# Altium schematic sheet Controller_Section.SchDoc
size A4; SheetNumber: 3; SheetTotal: 3
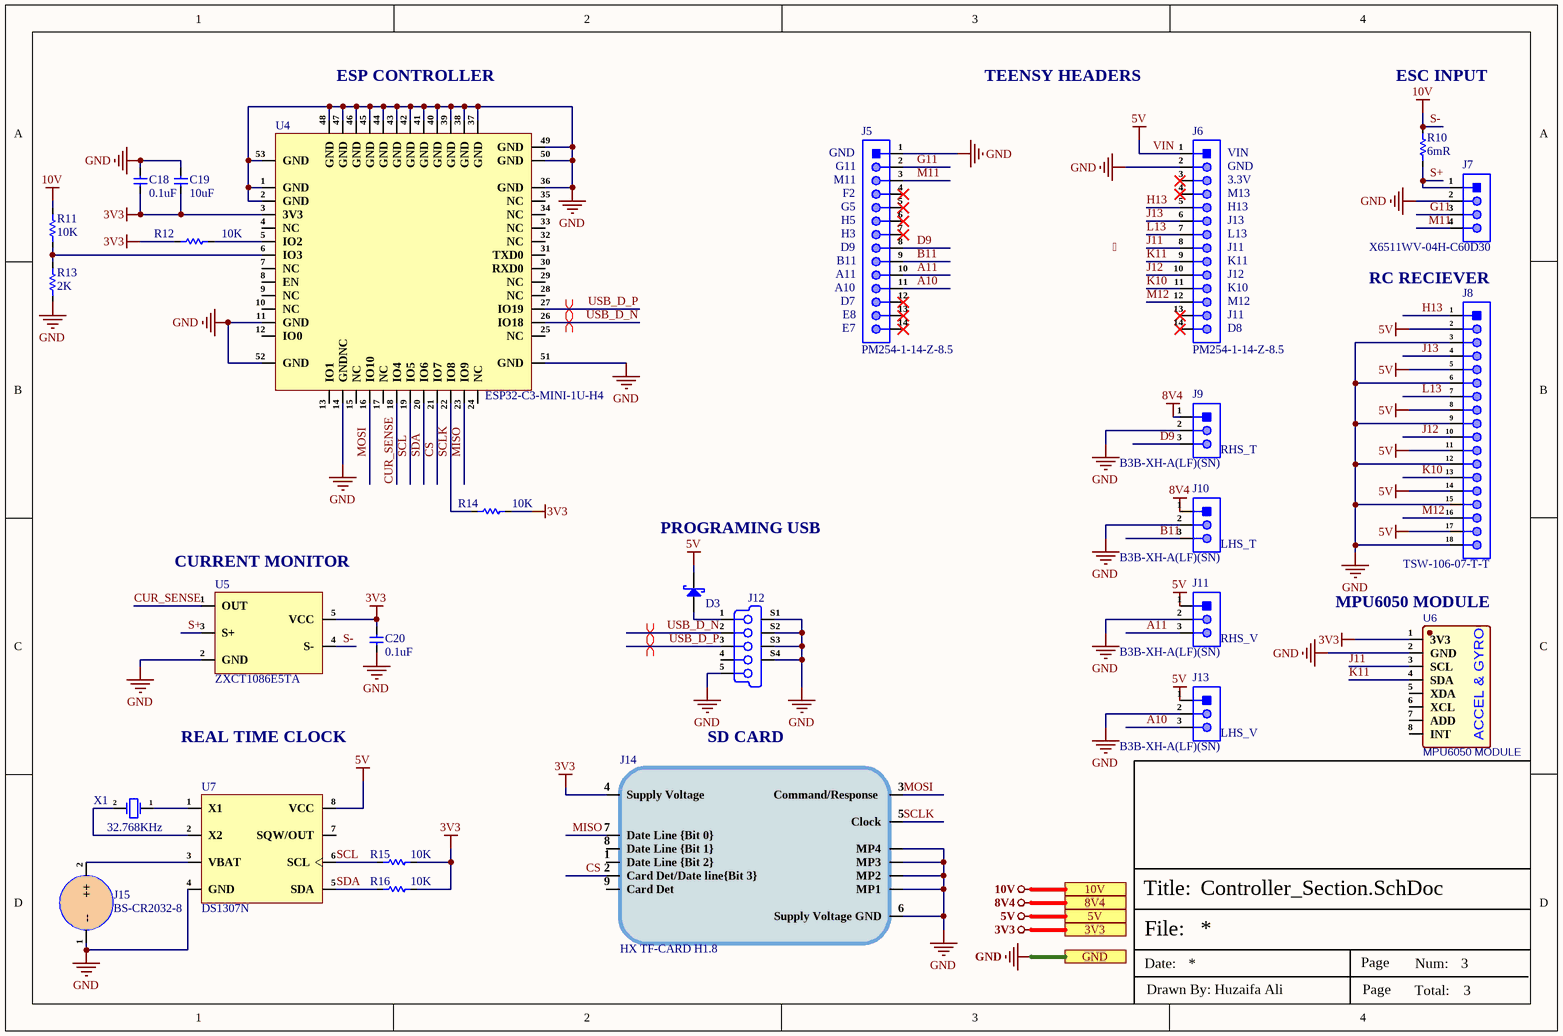
[diagram p0: Controller_Section.SchDoc]

## Parts
C18  0.1uF  [Cap-0402]
C19  10uF  [Cap-0402]
C20  0.1uF  [Cap-0402]
D3  SS34-MS  [SMA(DO-214AC)]  (value not drawn)
J5  PM254-1-14-Z-8.5  [HDR 1x14 TH (Female)]
J6  PM254-1-14-Z-8.5  [HDR 1x14 TH (Female)]
J7  X6511WV-04H-C60D30  [HDR1X4_]
J8  TSW-106-07-T-T  [TSW-106-07-T-T]
J9  B3B-XH-A(LF)(SN)  [B3B-XH-A(LF)(SN)_]
J10  B3B-XH-A(LF)(SN)  [B3B-XH-A(LF)(SN)_]
J11  B3B-XH-A(LF)(SN)  [B3B-XH-A(LF)(SN)_]
J12  HX MICRO XNJ JB  [HX MICRO XNJ JB]  (value not drawn)
J13  B3B-XH-A(LF)(SN)  [B3B-XH-A(LF)(SN)_]
J14  HX TF-CARD H1.8  [HX TF-CARD H1.8]
J15  BS-CR2032-8  [BS-CR2032-8]
R10  6mR  [RES-0805]
R11  10K  [Res-0402]
R12  10K  [Res-0402]
R13  2K  [Res-0402]
R14  10K  [Res-0402]
R15  10K  [Res-0402]
R16  10K  [Res-0402]
U4  ESP32-C3-MINI-1U-H4  [ESP32-C3-MINI-1U-H4.]
U5  ZXCT1086E5TA  [SOT-23-5]
U6  MPU6050 MODULE  [MPU6050_]
U7  DS1307N  [8-PDIP]
X1  32.768KHz  [DT-26]

## Ports
3V3 (see Power_Section[1D]), 5V (see Power_Section[1D]), 8V4 (see Power_Section[1D]), 10V (see Power_Section[1D]), GND (see Power_Section[1D])

## Nets
3V3: C18.1 C19.1 C20.2 J14.4(Supply_Voltage) R12.1 R14.2 R15.2 R16.2 U4.3(3V3) U5.5(VCC) U6.1(3V3) ; port 3V3
8V4: J9.1 J10.1 ; port 8V4
GND: C18.2 C19.2 C20.1 J5.1 J6.2 J7.2 J8.3 J8.6 J8.9 J8.12 J8.15 J8.18 J9.2 J10.2 J11.2 J12.5(GND) J12.S1(Shield) J12.S2(Shield) J12.S3(Shield) J12.S4(Shield) J13.2 J14.6(Supply_Voltage_GND) J14.MP1 J14.MP2 J14.MP3 J14.MP4 J15.1(--) R13.1 U4.1(GND) U4.2(GND) U4.11(GND) U4.14(GNDNC) U4.36(GND) U4.37(GND) U4.38(GND) U4.39(GND) U4.40(GND) U4.41(GND) U4.42(GND) U4.43(GND) U4.44(GND) U4.45(GND) U4.46(GND) U4.47(GND) U4.48(GND) U4.49(GND) U4.50(GND) U4.51(GND) U4.52(GND) U4.53(GND) U5.2(GND) U6.2(GND) U7.4(GND) ; port GND
S-: R10.1 R11.1 U5.4(S-) ; port 10V  [also labelled 10V]
VIN: D3.1(K) J6.1 J8.2 J8.5 J8.8 J8.11 J8.14 J8.17 J11.1 J13.1 U7.8(VCC) ; port 5V  [also labelled 5V]
A10: J5.11 J13.3
A11: J5.10 J11.3
B11: J5.9 J10.3
CS: J14.2(Card_Det/Date_line{Bit_3}) U4.21(IO7)
CUR_SENSE: U4.18(IO4) U5.1(OUT)
D9: J5.8 J9.3
G11: J5.2 J7.3
H13: J6.5 J8.1
J11: J6.8 U6.3(SCL)
J12: J6.10 J8.10
J13: J6.6 J8.4
K10: J6.11 J8.13
K11: J6.9 U6.4(SDA)
L13: J6.7 J8.7
M11: J5.3 J7.4
M12: J6.12 J8.16
MISO: J14.7(Date_Line_{Bit_0}) U4.23(IO9)
MOSI: J14.3(Command/Response) U4.16(IO10)
S+: J7.1 R10.2 U5.3(S+)
SCL: R15.1 U4.19(IO5) U7.6(SCL)
SCLK: J14.5(Clock) R14.1 U4.22(IO8)
SDA: R16.1 U4.20(IO6) U7.5(SDA)
USB_D_N: J12.2(D-) U4.26(IO18)
USB_D_P: J12.3(D+) U4.27(IO19)
NetD3_2: D3.2(A) J12.1(V_BUS_(5V))
NetJ15_2: J15.2(++) U7.3(VBAT)
NetR11_2: R11.2 R13.2 U4.6(IO3)
NetR12_2: R12.2 U4.5(IO2)
NetU7_1: U7.1(X1) X1.1(OSC1)
NetU7_2: U7.2(X2) X1.2(OSC2)

Not connected (* = marked no-connect by the designer): J5 4* 5* 6* 7* 12* 13* 14*; J6 3* 4* 13* 14*; J12 4(ID); J14 1(Date_Line_{Bit_2}) 8(Date_Line_{Bit_1}) 9(Card_Det); U4 4(NC) 7(NC) 8(EN) 9(NC) 10(NC) 12(IO0) 13(IO1) 15(NC) 17(NC) 24(NC) 25(NC) 28(NC) 29(NC) 30(RXD0) 31(TXD0) 32(NC) 33(NC) 34(NC) 35(NC); U6 5(XDA) 6(XCL) 7(ADD) 8(INT); U7 7(SQW/OUT)

## Layout directives
differential pair; net class USB_PROGRAM; differential pair class USB_PROGRAM_LINES; rule Impedance Constraint [Min = 85.00    Max = 90.00    ]; rule Matched Net Lengths [Tolerance = 50mil]: USB_D_N, USB_D_P

## Notes on the sheet
- (near U4) ESP CONTROLLER
- TEENSY HEADERS
- (near R10) ESC INPUT
- (near J5) GND
- (near J5) G11
- (near J6) VIN
- (near J6) GND
- (near J5) M11
- (near J5) D9
- (near J5) G5
- (near J5) H5
- (near J5) H3
- (near J5) F2
- (near J6) 3.3V
- (near J6) M13
- (near J6) H13
- (near J6) J13
- (near J6) L13
- (near J6) J11
- (near J5) A10
- (near J5) A11
- (near J5) B11
- (near J5) D7
- (near J6) J12
- (near J6) K10
- (near J6) K11
- (near J6) M12
- RC RECIEVER
- (near J5) E7
- (near J5) E8
- (near J6) D8
- (near J9) RHS_T
- (near U5) CURRENT MONITOR
- (near D3) PROGRAMING USB
- (near J10) LHS_T
- (near J11) RHS_V
- (near U6) MPU6050 MODULE
- REAL TIME CLOCK
- SD CARD
- (near J13) LHS_V
- Labels drawn without touching a wire or pin: 
- File:
- Title:
- Date:
- Page
- Num:
- Total:
- Drawn By: Huzaifa Ali
- (in symbol MPU6050 MODULE) ACCEL & GYRO

## Library data of the parts
C18 C20 = CC0402KRX7R8BB104: CAP CER 0.1UF 25V X7R 0402; Manufacturer: Yageo; Tolerance: 10%; Capacitance: 100nF; Dissipation Factor: 3.5%; Supplier 1: Digi-Key; Manufacturer Part Number: CC0402KRX7R8BB104; RoHS: Yes; Category: Ceramic Capacitors; Stock 1: 1841009; Pricing 1: 1=0.10000, 10=0.03100, 50=0.01700, 100=0.01390, 500=0.00990, 1000=0.00777, 2500=0.00707, 5000=0.00650 (USD); Mount: Surface Mount; Case/Package: 0402; Case Code (Imperial): 0402; Case Code (Metric): 1005; Min Operating Temperature: -55°C; Max Operating Temperature: 125°C; Dielectric: X7R; Voltage Rating: 25V; Voltage Rating (DC): 25V; Packaging: Tape and Reel; Termination: SMD/SMT; Resistor Type: Ceramic; Length: 1mm; Width: 0.02inch; Height: 0.5mm; Thickness: 0.022inch; Depth: 0.5mm; Radiation Hardening: No; Lead Free: Lead Free; Halogen Free: Halogen Free; ComponentLink1URL: https://datasheet.ciiva.com/11464/upy-gphc-x7r-6-3v-to-50v-8-11464889.pdf?src-supplier=Avnet; ComponentLink1Description: https://datasheet.ciiva.com/11464/upy-gphc-x7r-6-3v-to-50v-8-11464889.pdf?src-supplier=Avnet; ComponentLink2URL: https://datasheet.ciiva.com/13210/upy-gphc-x7r-6-3v-to-50v-8-12304-13210908.pdf?src-supplier=Mouser; ComponentLink2Description: https://datasheet.ciiva.com/13210/upy-gphc-x7r-6-3v-to-50v-8-12304-13210908.pdf?src-supplier=Mouser; ComponentLink3URL: https://datasheet.ciiva.com/17437/upy-gphc-x7r-6-3v-to-50v-8-17437357.pdf?src-supplier=Avnet+Europe; ComponentLink3Description: https://datasheet.ciiva.com/17437/upy-gphc-x7r-6-3v-to-50v-8-17437357.pdf?src-supplier=Avnet+Europe; Supplier Part Number 1: 311-2077-1-ND; LCSC Part Number: C105883
C19 = CL05A106MP5NUNC: CAP CER 10UF 10V X5R 0402; Manufacturer: Samsung; Tolerance: 20%; Item Type: Capacitor; Supplier 1: Avnet; Manufacturer Part Number: CL05A106MP5NUNC; RoHS: Yes; Category: Ceramic Capacitors; Stock 1: 1729850; Pricing 1: 10000=0.02537 (USD); Mount: Surface Mount; Case/Package: 0402; Case Code (Metric): 1005; Case Code (Imperial): 0402; Contact Plating: Tin; Min Operating Temperature: -55°C; Max Operating Temperature: 85°C; Package Quantity: 1; Packaging: Tape and Reel; Capacitance: 10uF; Voltage Rating: 10V; Dielectric: X5R; Termination: Wraparound; Series: CL; Construction: Flat; Length: 1mm; Width: 0.02inch; Thickness: 0.028inch; Depth: 0.5mm; Radiation Hardening: No; Lead Free: Lead Free; RoHS Compliant: Yes; ComponentLink1URL: https://datasheet.ciiva.com/25721/cl05a106mp5nunc-25721584.pdf?src-supplier=Digi-Key; ComponentLink1Description: https://datasheet.ciiva.com/25721/cl05a106mp5nunc-25721584.pdf?src-supplier=Digi-Key; ComponentLink2URL: https://datasheet.ciiva.com/26838/getdatasheetpartid-745310-26838170.pdf?src-supplier=Verical; ComponentLink2Description: https://datasheet.ciiva.com/26838/getdatasheetpartid-745310-26838170.pdf?src-supplier=Verical; Supplier Part Number 1: CL05A106MP5NUNC; LCSC Part Number: C315248
D3 = SS34-MS: 40V 3A 550mV@3A SMA(DO-214AC) Schottky Diodes ROHS; Manufacturer: MSKSEMI; Item Type: Diode; Manufacturer Part Number: SS34-MS; Package: SMA(DO-214AC); LCSC Part Number: C2836396; ComponentLink1Description: LCSC; ComponentLink1URL: https://www.lcsc.com/product-detail/Schottky-Diodes_MSKSEMI-SS34-MS_C2836396.html
J5 J6 = PM254-1-14-Z-8.5: 2.54mm Single Row 3A Brass Alloy 14P -40℃~+105℃ 260℃@5S Direct Insert 1x14P 8.5mm Top Square Hole Plugin,P=2.54mm Female Headers ROHS; Manufacturer: HCTL; Manufacturer Part Number: PM254-1-14-Z-8.5; Package: Plugin,P=2.54mm; LCSC Part Number: C2897377; Item Type: Female Header; ComponentLink1Description: LCSC; ComponentLink1URL: https://www.lcsc.com/product-detail/Female-Headers_HCTL-PM254-1-14-Z-8-5_C2897377.html
J7 = X6511WV-04H-C60D30: Gold 250V 3A Straight Square Pins 2.5mm 4P 260℃ 6mm -40℃~+105℃ 3mm 2.54mm Plugin Black Brass 1x4P Plugin,P=2.54mm Pin Headers ROHS; Manufacturer: XKB; Item Type: Male Header; ComponentLink1Description: LCSC; ComponentLink1URL: https://www.lcsc.com/product-detail/Pin-Headers_XKB-Connectivity-X6511WV-04H-C60D30_C706876.html; Manufacturer Part Number: X6511WV-04H-C60D30; Package: Plugin,P=2.54mm; LCSC Part Number: C706876
J8 = TSW-106-07-T-T: CONN HEADER VERT 18POS 2.54MM; Manufacturer: Samtec; Item Type: Connectors; Supplier: Arrow Electronics; LCSC Part Number: C5967361; Manufacturer Part Number: TSW-106-07-T-T; RoHS: Yes; Stock: 1529; ComponentLink1URL: http://www.samtec.com/ftppub/pdf/htsw_th.pdf?src-supplier=Avnet; ComponentLink1Description: http://www.samtec.com/ftppub/pdf/htsw_th.pdf?src-supplier=Avnet; ComponentLink2URL: https://datasheet.octopart.com/TSW-106-07-T-T-Samtec-datasheet-97325576.pdf?src-supplier=Sager+Electronics; ComponentLink2Description: https://datasheet.octopart.com/TSW-106-07-T-T-Samtec-datasheet-97325576.pdf?src-supplier=Sager+Electronics
J9-J11 J13 = B3B-XH-A(LF)(SN): CONN HEADER VERT 3POS 2.5MM; Manufacturer: JST; Current Rating: 3A; Number of Positions: 3; Connector Type: Male Pin; Voltage Rating (AC): 250V; Contact Resistance: 20mR; Insulation Resistance: 1GR; Gender: Male; Wire/Cable Gauge: 22AWG; Item Type: JST Connector; Supplier 1: Farnell; Manufacturer Part Number: B3B-XH-A(LF)(SN); RoHS: Yes; Category: Headers and Wire Housings; Stock 1: 114254; Pricing 1: 100=0.09250, 500=0.07700, 1000=0.06470, 2500=0.06340, 5000=0.06210, 10000=0.06080 (GBP); Mount: Through Hole; Contact Plating: Tin,Lead,Copper; Contact Material: Brass; Color: Natural; Housing Color: White; Housing Material: Polyamide; Min Operating Temperature: -25°C; Max Operating Temperature: 85°C; Number of Rows: 1; Packaging: Bulk; Termination: Press-Fit; Max Current Rating: 3A; Voltage Rating: 250V; Fastening Type: Detent; Number of Contacts: 3; Max Voltage Rating (AC): 250V; Max Voltage Rating (DC): 250V; Orientation: Straight; Length: 9.9mm; Pitch: 2.5mm; Lead Pitch: 2.5mm; Depth: 5.75mm; Lead Free: Lead Free; REACH SVHC: No SVHC; ComponentLink1URL: https://datasheet.ciiva.com/26894/getdatasheetpartid-640434-26894454.pdf?src-supplier=Verical; ComponentLink1Description: https://datasheet.ciiva.com/26894/getdatasheetpartid-640434-26894454.pdf?src-supplier=Verical; ComponentLink2URL: https://datasheet.ciiva.com/11746/0900766b8082653f-11746520.pdf?src-supplier=RSComponents; ComponentLink2Description: https://datasheet.ciiva.com/11746/0900766b8082653f-11746520.pdf?src-supplier=RSComponents; ComponentLink3URL: https://datasheet.ciiva.com/26894/getdatasheetpartid-440399-26894778.pdf?src-supplier=Verical; ComponentLink3Description: https://datasheet.ciiva.com/26894/getdatasheetpartid-440399-26894778.pdf?src-supplier=Verical; Supplier Part Number 1: 1516277; LCSC Part Number: C144394
J12 = HX MICRO XNJ JB: Female Micro-B SMD USB Connectors ROHS; Manufacturer: HANXIA; Item Type: Micro-B Connector; Manufacturer Part Number: HX MICRO XNJ JB; Package: Custom; LCSC Part Number: C5160305; ComponentLink1Description: LCSC; ComponentLink1URL: https://www.lcsc.com/product-detail/USB-Connectors_hanxia-HX-MICRO-XNJ-JB_C5160305.html
J14 = HX TF-CARD H1.8: -40℃~+70℃ 1.8mm Gold Card Slot MicroSD card (TF card) Brass Alloy Self-bouncing SMD SD Card / Memory Card Connector ROHS; Manufacturer: hanxia; Card Connection Mode: Pluggable; Item Type: MicroSD; ComponentLink1Description: LCSC; ComponentLink1URL: https://www.lcsc.com/product-detail/SD-Card-Memory-Card-Connector_hanxia-HX-TF-CARD-H1-8_C19189036.html; Manufacturer Part Number: HX TF-CARD H1.8; LCSC Part Number: C19189036
J15 = BS-CR2032-8: Battery holder -40℃~+85℃ Gold Copper end CR2032 SMD Button And Strip Battery Connector ROHS; Manufacturer: Lian Xin Technology; Item Type: Cell Holder; Manufacturer Part Number: BS-CR2032-8; Package: SMD; LCSC Part Number: C7498149; ComponentLink1Description: LCSC; ComponentLink1URL: https://www.lcsc.com/product-detail/Button-And-Strip-Battery-Connector_Lian-Xin-Technology-BS-CR2032-8_C7498149.html
R10 = RLM10FTSMR006: 500mW 6mΩ ±50ppm/℃ ±1% 0805 Current Sense Resistors / Shunt Resistors ROHS; Manufacturer: TA-I Tech; Manufacturer Part Number: RLM10FTSMR006; Package: 0805; LCSC Part Number: C163092; Item Type: Resistor; ComponentLink1Description: LCSC; ComponentLink1URL: https://www.lcsc.com/product-detail/Current-Sense-Resistors-Shunt-Resistors_TA-I-Tech-RLM10FTSMR006_C163092.html
R11 R12 R14-R16 = RT0402BRD0710KL: RES SMD 10K OHM 0.1% 1/16W 0402; Manufacturer: Yageo; Item Type: Resistor; Supplier: Future Electronics; Supplier Part Number: 1236728; Manufacturer Part Number: RT0402BRD0710KL; RoHS: Yes; Category: Chip SMD Resistors; Stock: 490000; Pricing: 10000=0.0218, 20000=0.0213, 30000=0.021, 50000=0.0206, 100000=0.0199 (USD); ComponentLink1URL: https://datasheet.ciiva.com/12836/pyu-rt-1-to-0-05-rohs-l-4-12836454.pdf?src-supplier=Mouser; ComponentLink1Description: https://datasheet.ciiva.com/12836/pyu-rt-1-to-0-05-rohs-l-4-12836454.pdf?src-supplier=Mouser; LCSC Part Number: C190095
R13 = RMC04022K1%N: 62.5mW ±1% 2kΩ 0402 Chip Resistor - Surface Mount ROHS; Manufacturer: TyoHM; Manufacturer Part Number: RMC04022K1%N; LCSC Part Number: C325372; Item Type: Resistor; Value: 2K; ComponentLink1Description: LCSC; ComponentLink1URL: https://www.lcsc.com/product-detail/Chip-Resistor-Surface-Mount_TyoHM-RMC04022K1-N_C325372.html
U4 = ESP32-C3-MINI-1U-H4: SMD,12.5x13.2mm WiFi Modules ROHS; Manufacturer: Espressif Systems; Item Type: IC; Manufacturer Part Number: ESP32-C3-MINI-1U-H4; LCSC Part Number: C3013922; Package: SMD,12.5x13.2mm
U5 = ZXCT1086E5TA: IC CURRENT MONITOR SOT25; Manufacturer: Diodes; Supplier: Future Electronics; LCSC Part Number: C154866; Manufacturer Part Number: ZXCT1086E5TA; RoHS: Yes; Item Type: IC; Stock: 9000; Pricing: 3000=0.69, 6000=0.665 (USD); ComponentLink1URL: https://datasheet.ciiva.com/1484/1383709-1484867.pdf?src-supplier=Element14; ComponentLink1Description: https://datasheet.ciiva.com/1484/1383709-1484867.pdf?src-supplier=Element14
U6 = MPU6050 MODULE: GY-521 6DOF 3 Axis Analog Gyro Sensor + 3 Axis Accelerometer Module; Contributor: jofenix; Manufacturer Part Number: MPU6050; Supplier: Aliexpress; spicePre: U; spiceSymbolName: MPU6050 MODULE
U7 = DS1307N: DIP-8 Real Time Clocks ROHS; Manufacturer: Maxim; Item Type: IC; Supplier: Mouser; LCSC Part Number: C434596; Manufacturer Part Number: DS1307N; RoHS: Yes; Stock: 754; Pricing: 1=6.11, 10=4.06, 50=4.06, 100=3.42, 1000=2.77, 10000=2.6 (USD); ComponentLink1URL: https://datasheet.ciiva.com/19457/1194695-19457341.pdf?src-supplier=Jameco; ComponentLink1Description: https://datasheet.ciiva.com/19457/1194695-19457341.pdf?src-supplier=Jameco; ComponentLink2URL: https://datasheet.ciiva.com/30480/0900766b81253c0a-30480875.pdf?src-supplier=Rs; ComponentLink2Description: https://datasheet.ciiva.com/30480/0900766b81253c0a-30480875.pdf?src-supplier=Rs; ComponentLink3URL: https://datasheet.ciiva.com/1240/ds1307-1240473.pdf?src-supplier=Digikey; ComponentLink3Description: https://datasheet.ciiva.com/1240/ds1307-1240473.pdf?src-supplier=Digikey; ComponentLink4URL: https://datasheet.ciiva.com/3304/ds1307-3304456.pdf?src-supplier=Avnet; ComponentLink4Description: https://datasheet.ciiva.com/3304/ds1307-3304456.pdf?src-supplier=Avnet
X1 = DT-26 32.768KHz: DT-26 Crystals ROHS; Manufacturer: KDS Daishinku; Manufacturer Part Number: DT-26 32.768KHz; Package: DT-26; LCSC Part Number: C93229; Item Type: Crystal; ComponentLink1Description: LCSC; ComponentLink1URL: https://www.lcsc.com/product-detail/Crystals_KDS-Daishinku-DT-26-32-768KHz_C93229.html